# Altium schematic sheet ZYNQ_Power.SchDoc
size A4; SheetNumber: 3; SheetTotal: 11
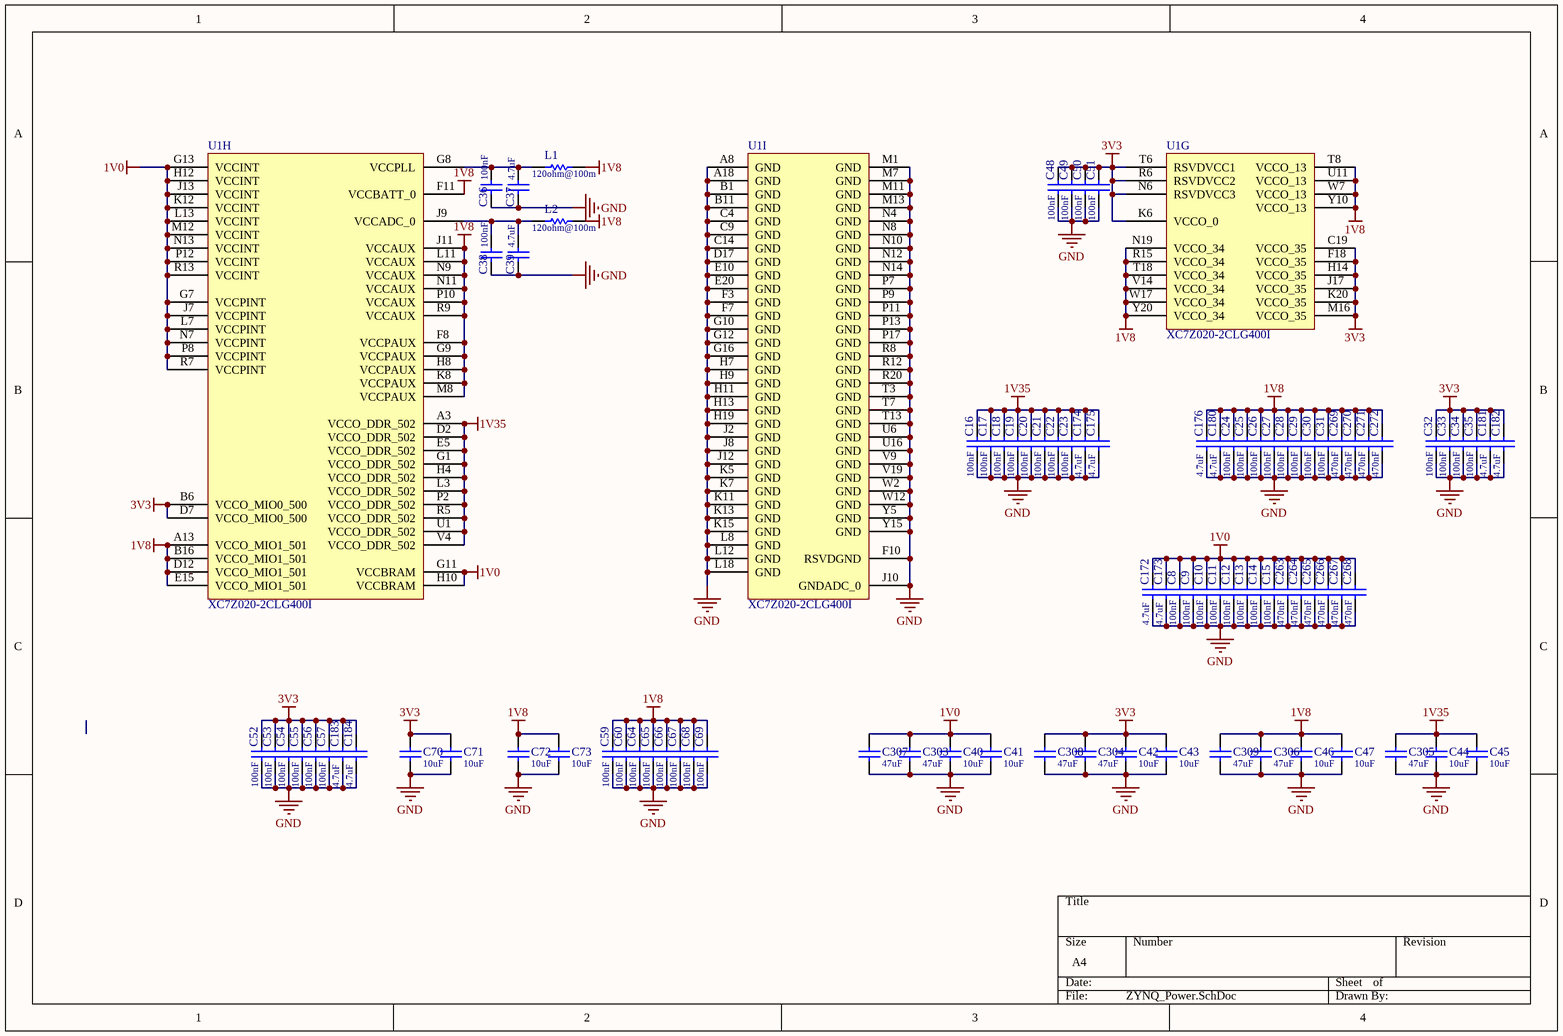
[diagram p0: ZYNQ_Power.SchDoc]

## Parts
C8  value 100nF  [C0402-S]  (hidden comment: Cap-S)
C9  value 100nF  [C0402-S]  (hidden comment: Cap-S)
C10  value 100nF  [C0402-S]  (hidden comment: Cap-S)
C11  value 100nF  [C0402-S]  (hidden comment: Cap-S)
C12  value 100nF  [C0402-S]  (hidden comment: Cap-S)
C13  value 100nF  [C0402-S]  (hidden comment: Cap-S)
C14  value 100nF  [C0402-S]  (hidden comment: Cap-S)
C15  value 100nF  [C0402-S]  (hidden comment: Cap-S)
C16  value 100nF  [C0402-S]  (hidden comment: Cap-S)
C17  value 100nF  [C0402-S]  (hidden comment: Cap-S)
C18  value 100nF  [C0402-S]  (hidden comment: Cap-S)
C19  value 100nF  [C0402-S]  (hidden comment: Cap-S)
C20  value 100nF  [C0402-S]  (hidden comment: Cap-S)
C21  value 100nF  [C0402-S]  (hidden comment: Cap-S)
C22  value 100nF  [C0402-S]  (hidden comment: Cap-S)
C23  value 100nF  [C0402-S]  (hidden comment: Cap-S)
C24  value 100nF  [C0402-S]  (hidden comment: Cap-S)
C25  value 100nF  [C0402-S]  (hidden comment: Cap-S)
C26  value 100nF  [C0402-S]  (hidden comment: Cap-S)
C27  value 100nF  [C0402-S]  (hidden comment: Cap-S)
C28  value 100nF  [C0402-S]  (hidden comment: Cap-S)
C29  value 100nF  [C0402-S]  (hidden comment: Cap-S)
C30  value 100nF  [C0402-S]  (hidden comment: Cap-S)
C31  value 100nF  [C0402-S]  (hidden comment: Cap-S)
C32  value 100nF  [C0402-S]  (hidden comment: Cap-S)
C33  value 100nF  [C0402-S]  (hidden comment: Cap-S)
C34  value 100nF  [C0402-S]  (hidden comment: Cap-S)
C35  value 100nF  [C0402-S]  (hidden comment: Cap-S)
C36  value 100nF  [C0402-S]  (hidden comment: Cap-S)
C37  value 4.7uF  [C0402-S]  (hidden comment: Cap-S)
C38  value 100nF  [C0402-S]  (hidden comment: Cap-S)
C39  value 4.7uF  [C0402-S]  (hidden comment: Cap-S)
C40  value 10uF  [C0402-S]  (hidden comment: Cap-S)
C41  value 10uF  [C0402-S]  (hidden comment: Cap-S)
C42  value 10uF  [C0402-S]  (hidden comment: Cap-S)
C43  value 10uF  [C0402-S]  (hidden comment: Cap-S)
C44  value 10uF  [C0402-S]  (hidden comment: Cap-S)
C45  value 10uF  [C0402-S]  (hidden comment: Cap-S)
C46  value 10uF  [C0402-S]  (hidden comment: Cap-S)
C47  value 10uF  [C0402-S]  (hidden comment: Cap-S)
C48  value 100nF  [C0402-S]  (hidden comment: Cap-S)
C49  value 100nF  [C0402-S]  (hidden comment: Cap-S)
C50  value 100nF  [C0402-S]  (hidden comment: Cap-S)
C51  value 100nF  [C0402-S]  (hidden comment: Cap-S)
C52  value 100nF  [C0402-S]  (hidden comment: Cap-S)
C53  value 100nF  [C0402-S]  (hidden comment: Cap-S)
C54  value 100nF  [C0402-S]  (hidden comment: Cap-S)
C55  value 100nF  [C0402-S]  (hidden comment: Cap-S)
C56  value 100nF  [C0402-S]  (hidden comment: Cap-S)
C57  value 100nF  [C0402-S]  (hidden comment: Cap-S)
C59  value 100nF  [C0402-S]  (hidden comment: Cap-S)
C60  value 100nF  [C0402-S]  (hidden comment: Cap-S)
C64  value 100nF  [C0402-S]  (hidden comment: Cap-S)
C65  value 100nF  [C0402-S]  (hidden comment: Cap-S)
C66  value 100nF  [C0402-S]  (hidden comment: Cap-S)
C67  value 100nF  [C0402-S]  (hidden comment: Cap-S)
C68  value 100nF  [C0402-S]  (hidden comment: Cap-S)
C69  value 100nF  [C0402-S]  (hidden comment: Cap-S)
C70  value 10uF  [C0402-S]  (hidden comment: Cap-S)
C71  value 10uF  [C0402-S]  (hidden comment: Cap-S)
C72  value 10uF  [C0402-S]  (hidden comment: Cap-S)
C73  value 10uF  [C0402-S]  (hidden comment: Cap-S)
C172  value 4.7uF  [C0402-S]  (hidden comment: Cap-S)
C173  value 4.7uF  [C0402-S]  (hidden comment: Cap-S)
C174  value 4.7uF  [C0402-S]  (hidden comment: Cap-S)
C175  value 4.7uF  [C0402-S]  (hidden comment: Cap-S)
C176  value 4.7uF  [C0402-S]  (hidden comment: Cap-S)
C180  value 4.7uF  [C0402-S]  (hidden comment: Cap-S)
C181  value 4.7uF  [C0402-S]  (hidden comment: Cap-S)
C182  value 4.7uF  [C0402-S]  (hidden comment: Cap-S)
C183  value 4.7uF  [C0402-S]  (hidden comment: Cap-S)
C184  value 4.7uF  [C0402-S]  (hidden comment: Cap-S)
C263  value 470nF  [C0402-S]  (hidden comment: Cap-S)
C264  value 470nF  [C0402-S]  (hidden comment: Cap-S)
C265  value 470nF  [C0402-S]  (hidden comment: Cap-S)
C266  value 470nF  [C0402-S]  (hidden comment: Cap-S)
C267  value 470nF  [C0402-S]  (hidden comment: Cap-S)
C268  value 470nF  [C0402-S]  (hidden comment: Cap-S)
C269  value 470nF  [C0402-S]  (hidden comment: Cap-S)
C270  value 470nF  [C0402-S]  (hidden comment: Cap-S)
C271  value 470nF  [C0402-S]  (hidden comment: Cap-S)
C272  value 470nF  [C0402-S]  (hidden comment: Cap-S)
C303  value 47uF  [C0603-L]  (hidden comment: Cap-S)
C304  value 47uF  [C0603-L]  (hidden comment: Cap-S)
C305  value 47uF  [C0603-L]  (hidden comment: Cap-S)
C306  value 47uF  [C0603-L]  (hidden comment: Cap-S)
C307  value 47uF  [C0603-L]  (hidden comment: Cap-S)
C308  value 47uF  [C0603-L]  (hidden comment: Cap-S)
C309  value 47uF  [C0603-L]  (hidden comment: Cap-S)
L1  value 120ohm@100m  [R0603-L]  (hidden comment: R)
L2  value 120ohm@100m  [R0603-L]  (hidden comment: R)
U1  XC7Z020-2CLG400I  [CLG400]  (parts G,H,I of 9)

## Nets
1V0: C8.2 C9.2 C10.2 C11.2 C12.2 C13.2 C14.2 C15.2 C40.2 C41.2 C172.2 C173.2 C263.2 C264.2 C265.2 C266.2 C267.2 C268.2 C303.2 C307.2 U1.G7(VCCPINT) U1.G11(VCCBRAM) U1.G13(VCCINT) U1.H10(VCCBRAM) U1.H12(VCCINT) U1.J7(VCCPINT) U1.J13(VCCINT) U1.K12(VCCINT) U1.L7(VCCPINT) U1.L13(VCCINT) U1.M12(VCCINT) U1.N7(VCCPINT) U1.N13(VCCINT) U1.P8(VCCPINT) U1.P12(VCCINT) U1.R7(VCCPINT) U1.R13(VCCINT)
1V8: C24.2 C25.2 C26.2 C27.2 C28.2 C29.2 C30.2 C31.2 C46.2 C47.2 C59.2 C60.2 C64.2 C65.2 C66.2 C67.2 C68.2 C69.2 C72.2 C73.2 C176.2 C180.2 C269.2 C270.2 C271.2 C272.2 C306.2 C309.2 L1.2 L2.2 U1.A13(VCCO_MIO1_501) U1.B16(VCCO_MIO1_501) U1.D12(VCCO_MIO1_501) U1.E15(VCCO_MIO1_501) U1.F8(VCCPAUX) U1.F11(VCCBATT_0) U1.G9(VCCPAUX) U1.H8(VCCPAUX) U1.J11(VCCAUX) U1.K8(VCCPAUX) U1.L11(VCCAUX) U1.M8(VCCPAUX) U1.N9(VCCAUX) U1.N11(VCCAUX) U1.N19(VCCO_34) U1.P10(VCCAUX) U1.R9(VCCAUX) U1.R15(VCCO_34) U1.T8(VCCO_13) U1.T18(VCCO_34) U1.U11(VCCO_13) U1.V14(VCCO_34) U1.W7(VCCO_13) U1.W17(VCCO_34) U1.Y10(VCCO_13) U1.Y20(VCCO_34)
1V35: C16.2 C17.2 C18.2 C19.2 C20.2 C21.2 C22.2 C23.2 C44.2 C45.2 C174.2 C175.2 C305.2 U1.A3(VCCO_DDR_502) U1.D2(VCCO_DDR_502) U1.E5(VCCO_DDR_502) U1.G1(VCCO_DDR_502) U1.H4(VCCO_DDR_502) U1.L3(VCCO_DDR_502) U1.P2(VCCO_DDR_502) U1.R5(VCCO_DDR_502) U1.U1(VCCO_DDR_502) U1.V4(VCCO_DDR_502)
3V3: C32.2 C33.2 C34.2 C35.2 C42.2 C43.2 C48.2 C49.2 C50.2 C51.2 C52.2 C53.2 C54.2 C55.2 C56.2 C57.2 C70.2 C71.2 C181.2 C182.2 C183.2 C184.2 C304.2 C308.2 U1.B6(VCCO_MIO0_500) U1.C19(VCCO_35) U1.D7(VCCO_MIO0_500) U1.F18(VCCO_35) U1.H14(VCCO_35) U1.J17(VCCO_35) U1.K6(VCCO_0) U1.K20(VCCO_35) U1.M16(VCCO_35) U1.N6(RSVDVCC3) U1.R6(RSVDVCC2) U1.T6(RSVDVCC1)
GND: C8.1 C9.1 C10.1 C11.1 C12.1 C13.1 C14.1 C15.1 C16.1 C17.1 C18.1 C19.1 C20.1 C21.1 C22.1 C23.1 C24.1 C25.1 C26.1 C27.1 C28.1 C29.1 C30.1 C31.1 C32.1 C33.1 C34.1 C35.1 C36.1 C37.1 C38.1 C39.1 C40.1 C41.1 C42.1 C43.1 C44.1 C45.1 C46.1 C47.1 C48.1 C49.1 C50.1 C51.1 C52.1 C53.1 C54.1 C55.1 C56.1 C57.1 C59.1 C60.1 C64.1 C65.1 C66.1 C67.1 C68.1 C69.1 C70.1 C71.1 C72.1 C73.1 C172.1 C173.1 C174.1 C175.1 C176.1 C180.1 C181.1 C182.1 C183.1 C184.1 C263.1 C264.1 C265.1 C266.1 C267.1 C268.1 C269.1 C270.1 C271.1 C272.1 C303.1 C304.1 C305.1 C306.1 C307.1 C308.1 C309.1 U1.A8(GND) U1.A18(GND) U1.B1(GND) U1.B11(GND) U1.C4(GND) U1.C9(GND) U1.C14(GND) U1.D17(GND) U1.E10(GND) U1.E20(GND) U1.F3(GND) U1.F7(GND) U1.F10(RSVDGND) U1.G10(GND) U1.G12(GND) U1.G16(GND) U1.H7(GND) U1.H9(GND) U1.H11(GND) U1.H13(GND) U1.H19(GND) U1.J2(GND) U1.J8(GND) U1.J10(GNDADC_0) U1.J12(GND) U1.K5(GND) U1.K7(GND) U1.K11(GND) U1.K13(GND) U1.K15(GND) U1.L8(GND) U1.L12(GND) U1.L18(GND) U1.M1(GND) U1.M7(GND) U1.M11(GND) U1.M13(GND) U1.N4(GND) U1.N8(GND) U1.N10(GND) U1.N12(GND) U1.N14(GND) U1.P7(GND) U1.P9(GND) U1.P11(GND) U1.P13(GND) U1.P17(GND) U1.R8(GND) U1.R12(GND) U1.R20(GND) U1.T3(GND) U1.T7(GND) U1.T13(GND) U1.U6(GND) U1.U16(GND) U1.V9(GND) U1.V19(GND) U1.W2(GND) U1.W12(GND) U1.Y5(GND) U1.Y15(GND)
NetC36_2: C36.2 C37.2 L1.1 U1.G8(VCCPLL)
NetC38_2: C38.2 C39.2 L2.1 U1.J9(VCCADC_0)

## Library data of the parts
C8-C57 C59 C60 C64-C73 C172-C176 C180-C184 C263-C272 C303-C309 = Cap-S: 贴片瓷片电容
L1 L2 = Res: 贴片电阻
U1 = CMP-0363-00003-3: 733 MHz Zynq™-7000 AP SoC, 130 PS I/O, 125 FPGA I/O, 400-Ball BGA, Speed Grade 2, Industrial Grade, Pb-Free; LUTs: 53200; Flip Flops: 106400; Speed Grade: -2; Extensible Block RAM (# 36Kb Blocks): 560 KB (140); ComponentLink2URL: http://www.xilinx.com/support/documentation/user_guides/ug865-Zynq-7000-Pkg-Pinout.pdf; ComponentLink1Description: Datasheet; PartNumber: XC7Z020-2CLG400I; ComponentLink3URL: http://www.xilinx.com/support/documentation/data_sheets/ds187-XC7Z010-XC7Z020-Data-Sheet.pdf; Mounting Technology: Surface Mount; ComponentLink6Description: PCB and Layout Guide; ComponentLink3Description: DC and AC Switching Characteristics; ComponentLink4Description: Package File; PackageVersion: Rev 1.1, 09/2012; ComponentLink6URL: http://www.xilinx.com/support/documentation/user_guides/ug483_7Series_PCB.pdf; PackageDescription: Wire-Bond Chip-Scale BGA, Body 17 x 17 mm, 0.8 mm Pitch; ComponentLink5Description: Packaging and Pinout; Generic Part Number: XC7Z020; RoHS: Pb-Free; PackageReference: CLG400; ComponentLink1URL: http://www.xilinx.com/support/documentation/data_sheets/ds190-Zynq-7000-Overview.pdf; ComponentLink2Description: Package Specification; ComponentLink5URL: http://www.xilinx.com/support/documentation/user_guides/ug865-Zynq-7000-Pkg-Pinout.pdf; DatasheetVersion: v1.2; ComponentLink4URL: http://www.xilinx.com/support/packagefiles/z7packages/xc7z020clg400pkg.txt; Code_JEDEC: MO-275-MMAA-1